# Altium schematic sheet PWM_FMU.SchDoc
size A4; SheetNumber: 4; SheetTotal: 5
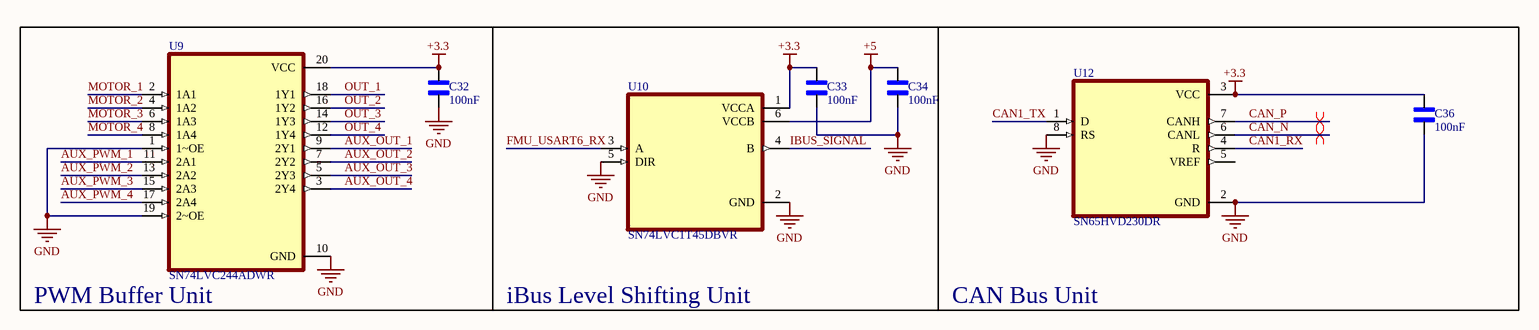
[diagram p0: PWM_FMU.SchDoc]

## Parts
C32  100nF  [CAPC2012X135N]
C33  100nF  [CAPC2012X135N]
C34  100nF  [CAPC2012X135N]
C36  100nF  [CAPC2012X135N]
U9  SN74LVC244ADWR  [SOIC127P1030X265-20N]
U10  SN74LVC1T45DBVR  [SOT95P280X145-6N]
U12  SN65HVD230DR  [SOIC127P599X175-8N]

## Blocks framed on the sheet
PWM Buffer Unit: C32 U9
iBus Level Shifting Unit: C33 C34 U10
CAN Bus Unit: C36 U12

## Nets
+3.3: C32.2 C33.2 C36.2 U9.20(VCC) U10.1(VCCA) U12.3(VCC)
+5: C34.2 U10.6(VCCB)
GND: C32.1 C33.1 C34.1 C36.1 U9.1(1~OE) U9.10(GND) U9.19(2~OE) U10.2(GND) U10.5(DIR) U12.2(GND) U12.8(RS)
AUX_OUT_1: U9.9(2Y1)
AUX_OUT_2: U9.7(2Y2)
AUX_OUT_3: U9.5(2Y3)
AUX_OUT_4: U9.3(2Y4)
AUX_PWM_1: U9.11(2A1)
AUX_PWM_2: U9.13(2A2)
AUX_PWM_3: U9.15(2A3)
AUX_PWM_4: U9.17(2A4)
CAN1_RX: U12.4(R)
CAN1_TX: U12.1(D)
CAN_N: U12.6(CANL)
CAN_P: U12.7(CANH)
FMU_USART6_RX: U10.3(A)
IBUS_SIGNAL: U10.4(B)
MOTOR_1: U9.2(1A1)
MOTOR_2: U9.4(1A2)
MOTOR_3: U9.6(1A3)
MOTOR_4: U9.8(1A4)
OUT_1: U9.18(1Y1)
OUT_2: U9.16(1Y2)
OUT_3: U9.14(1Y3)
OUT_4: U9.12(1Y4)

Not connected (* = marked no-connect by the designer): U12 5(VREF)

## Layout directives
differential pair: CAN_N, CAN_P

## Library data of the parts
C32-C34 C36 = GRM21BR71H104KA01L: ÐšÐ¾Ð½Ð´ÐµÐ½ÑÐ°Ñ‚Ð¾Ñ€ SMD X7R(EIA) Ñ Ñ‘Ð¼ÐºÐ¾ÑÑ‚ÑŒÑŽ: 0,10 Ð¼ÐºÐ¤ Â± 10%. ÐÐ¾Ð¼Ð¸Ð½Ð°Ð»ÑŒÐ½Ð¾Ðµ Ð½Ð°Ð¿Ñ€ÑÐ¶ÐµÐ½Ð¸Ðµ: 50 Ð’ Ð¿Ð¾ÑÑ‚Ð¾ÑÐ½Ð½Ð¾Ð³Ð¾ Ñ‚Ð¾ÐºÐ°; MF: Murata; SnapEDA_Link: https://www.snapeda.com/parts/GRM21BR71H104KA01L/Murata/view-part/?ref=snap; Package: 805-2 Murata; Value: *; MP: GRM21BR71H104KA01L; Check_prices: https://www.snapeda.com/parts/GRM21BR71H104KA01L/Murata/view-part/?ref=eda
U9 = SN74LVC244ADWR: 8-ch, 1.65-V to 3.6-V buffers with 3-state outputs; MF: Texas Instruments; SnapEDA_Link: https://www.snapeda.com/parts/SN74LVC244ADWR/Texas+Instruments/view-part/?ref=snap; Package: SOIC-20 Texas Instruments; Value: *; MP: SN74LVC244ADWR; Check_prices: https://www.snapeda.com/parts/SN74LVC244ADWR/Texas+Instruments/view-part/?ref=eda
U10 = SN74LVC1T45DBVR: Single-Bit Dual-Supply Bus Transceiver with Configurable Voltage-Level Shifting and 3-State Outputs; MF: Texas Instruments; SnapEDA_Link: https://www.snapeda.com/parts/SN74LVC1T45DBVR/Texas+Instruments/view-part/?ref=snap; Package: SOT-23-6 Texas Instruments; Value: *; MP: SN74LVC1T45DBVR; Check_prices: https://www.snapeda.com/parts/SN74LVC1T45DBVR/Texas+Instruments/view-part/?ref=eda
U12 = SN65HVD230DR: 3.3 V CAN Transceiver with Standby Mode; MF: Texas Instruments; SnapEDA_Link: https://www.snapeda.com/parts/SN65HVD230DR/Texas+Instruments/view-part/?ref=snap; Package: SOIC-8 Texas Instruments; Value: *; MP: SN65HVD230DR; Check_prices: https://www.snapeda.com/parts/SN65HVD230DR/Texas+Instruments/view-part/?ref=eda